# Altium schematic sheet Sensor_Section.SchDoc
size 420 x 297 mm; SheetNumber: 5; SheetTotal: 5
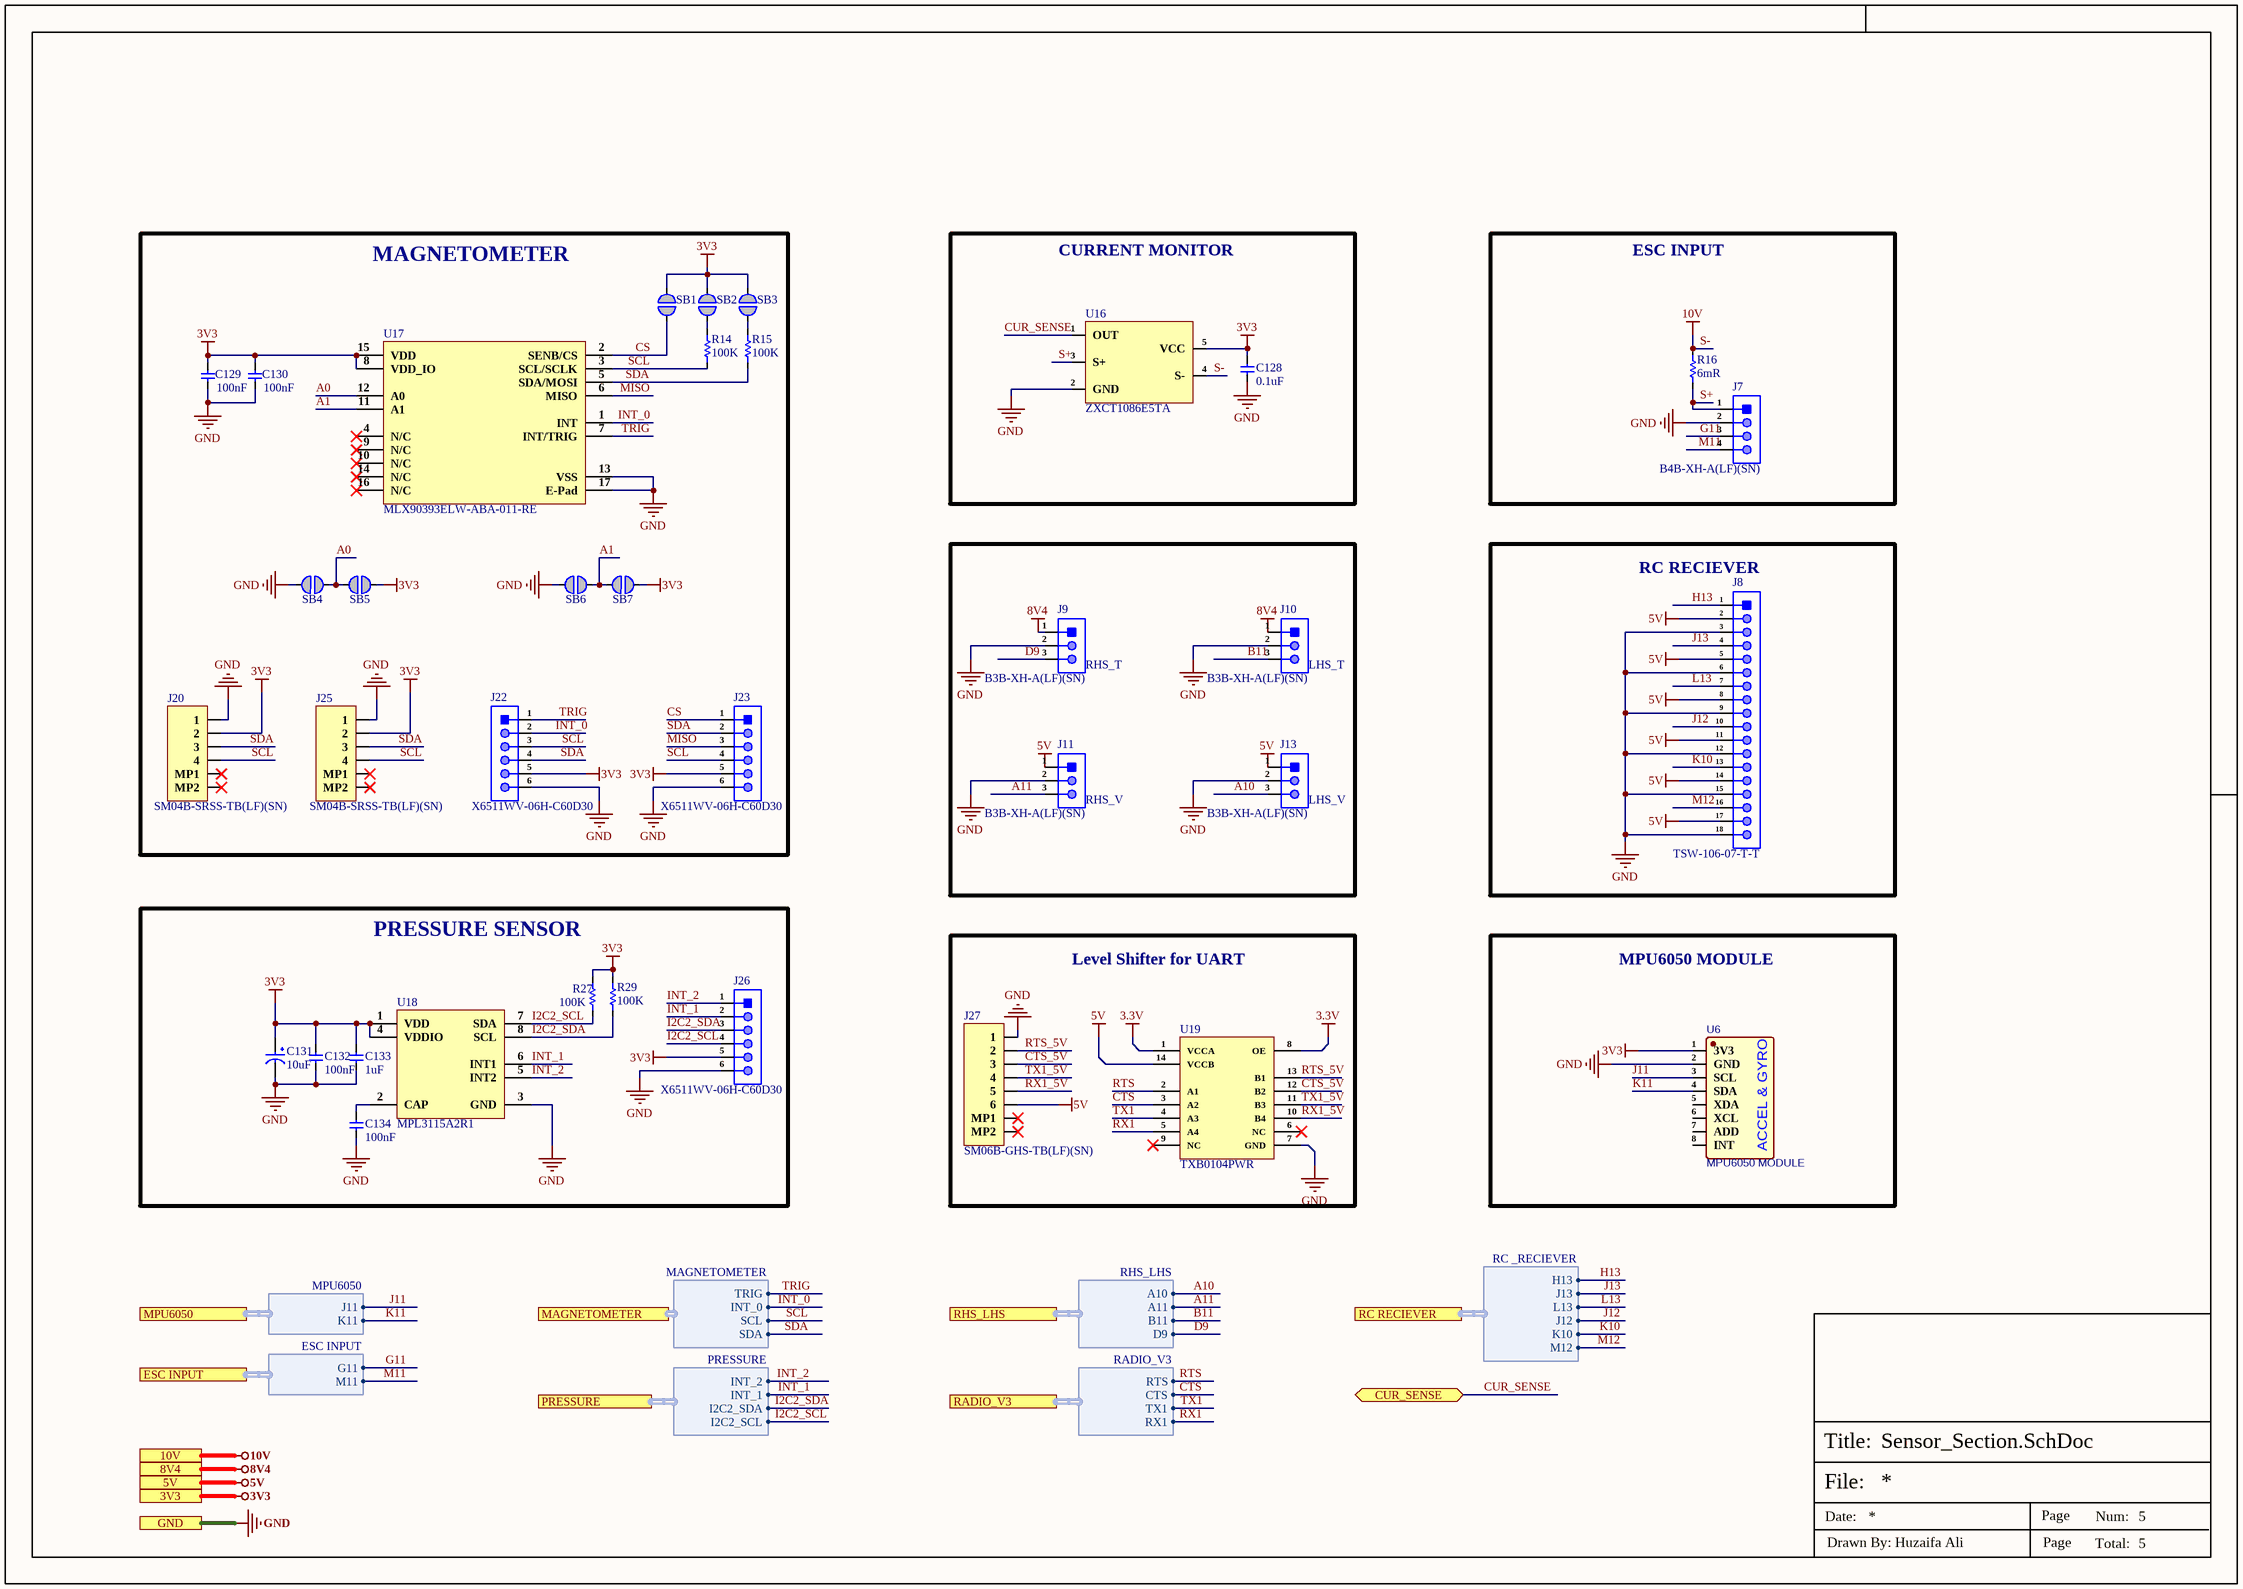
[diagram p0: Sensor_Section.SchDoc]

## Parts
C128  0.1uF  [Cap-0402]
C129  100nF  [cap-0402]
C130  100nF  [cap-0402]
C131  10uF  [Tant-0603]
C132  100nF  [cap-0402]
C133  1uF  [Cap-0402]
C134  100nF  [cap-0402]
J7  B4B-XH-A(LF)(SN)  [B4B-XH-A(LF)(SN).]
J8  TSW-106-07-T-T  [TSW-106-07-T-T]
J9  B3B-XH-A(LF)(SN)  [B3B-XH-A(LF)(SN)_]
J10  B3B-XH-A(LF)(SN)  [B3B-XH-A(LF)(SN)_]
J11  B3B-XH-A(LF)(SN)  [B3B-XH-A(LF)(SN)_]
J13  B3B-XH-A(LF)(SN)  [B3B-XH-A(LF)(SN)_]
J20  SM04B-SRSS-TB(LF)(SN)  [SM04B-SRSS-TB(LF)(SN)]
J22  X6511WV-06H-C60D30  [HDR1X6_]
J23  X6511WV-06H-C60D30  [HDR1X6_]
J25  SM04B-SRSS-TB(LF)(SN)  [SM04B-SRSS-TB(LF)(SN)]
J26  X6511WV-06H-C60D30  [HDR1X6_]
J27  SM06B-GHS-TB(LF)(SN)  [SM06B-GHS-TB(LF)(SN)]
R14  100K  [Res-0402]
R15  100K  [Res-0402]
R16  6mR  [RES-0805]
R27  100K  [Res-0402]
R29  100K  [Res-0402]
SB1  Solder Bridge 0603  [Solder Bridge]  (value not drawn)  (no BOM)
SB2  Solder Bridge 0603  [Solder Bridge]  (value not drawn)  (no BOM)
SB3  Solder Bridge 0603  [Solder Bridge]  (value not drawn)  (no BOM)
SB4  Solder Bridge 0603  [Solder Bridge]  (value not drawn)  (no BOM)
SB5  Solder Bridge 0603  [Solder Bridge]  (value not drawn)  (no BOM)
SB6  Solder Bridge 0603  [Solder Bridge]  (value not drawn)  (no BOM)
SB7  Solder Bridge 0603  [Solder Bridge]  (value not drawn)  (no BOM)
U6  MPU6050 MODULE  [MPU6050_]
U16  ZXCT1086E5TA  [SOT-23-5]
U17  MLX90393ELW-ABA-011-RE  [QFN-16-EP(3x3)]
U18  MPL3115A2R1  [LGA-8(3x5)]
U19  TXB0104PWR  [14-TSSOP]

## Blocks framed on the sheet
MAGNETOMETER: C129 C130 J20 J22 J23 J25 R14 R15 SB1-SB7 U17
CURRENT MONITOR: C128 U16
ESC INPUT: J7 R16
RC RECIEVER: J8
PRESSURE SENSOR: C131-C134 J26 R27 R29 U18
Level Shifter for UART: J27 U19
MPU6050 MODULE: U6

## Ports
3V3 (see Top_Section[4B], Power_Section[1D], Teensy_4.1_Section(B)[4D], Teensy_4.1_Section[5D]), 5V (see Top_Section[4B], Power_Section[1D]), 8V4 (see Top_Section[4B], Power_Section[1D]), 10V (see Top_Section[4B], Power_Section[1D]), CUR_SENSE (bidir, see Top_Section[4B], Teensy_4.1_Section(B)[2D]), ESC INPUT (harness ESC INPUT, see Top_Section[4B], Teensy_4.1_Section[2D]), GND (see Top_Section[5C], Power_Section[1D], Teensy_4.1_Section(B)[4D], Teensy_4.1_Section[5D]), MAGNETOMETER (harness MAGNETOMETER, see Top_Section[4C], Teensy_4.1_Section(B)[1D]), MPU6050 (harness MPU6050, see Top_Section[4B], Teensy_4.1_Section[2D]), PRESSURE (harness PRESSURE, see Top_Section[4C], Teensy_4.1_Section(B)[1D]), RADIO_V3 (harness RADIO_V3, see Top_Section[4C], Teensy_4.1_Section(B)[3D]), RC RECIEVER (harness RC _RECIEVER, see Top_Section[4B], Teensy_4.1_Section[1D]), RHS_LHS (harness RHS_LHS, see Top_Section[4B], Teensy_4.1_Section[1D])

## Harnesses
RC _RECIEVER: H13, J13, L13, J12, K10, M12
RHS_LHS: A10, A11, B11, D9
PRESSURE: INT_2, INT_1, I2C2_SDA, I2C2_SCL
RADIO_V3: RTS, CTS, TX1, RX1
MAGNETOMETER: TRIG, INT_0, SCL, SDA
MPU6050: J11, K11
ESC INPUT: G11, M11

## Nets
3.3V: U19.1(VCCA) U19.8(OE)
3V3: C128.2 C129.2 C130.2 C131.1 C132.2 C133.2 J20.2 J22.5 J23.5 J25.2 J26.5 R27.2 R29.2 SB1.1 SB2.1 SB3.1 SB5.1 SB7.1 U6.1(3V3) U16.5(VCC) U17.8(VDD_IO) U17.15(VDD) U18.1(VDD) U18.4(VDDIO) ; port 3V3
5V: J8.2 J8.5 J8.8 J8.11 J8.14 J8.17 J11.1 J13.1 J27.6 U19.14(VCCB) ; port 5V
8V4: J9.1 J10.1 ; port 8V4
GND: C128.1 C129.1 C130.1 C131.2 C132.1 C133.1 C134.1 J7.2 J8.3 J8.6 J8.9 J8.12 J8.15 J8.18 J9.2 J10.2 J11.2 J13.2 J20.1 J22.6 J23.6 J25.1 J26.6 J27.1 SB4.2 SB6.2 U6.2(GND) U16.2(GND) U17.13(VSS) U17.17(E-Pad) U18.3(GND) U19.7(GND) ; port GND
S-: R16.1 U16.4(S-) ; port 10V  [also labelled 10V]
A0: SB4.1 SB5.2 U17.12(A0)
A1: SB6.1 SB7.2 U17.11(A1)
A10: J13.3 ; port RHS_LHS.A10
A11: J11.3 ; port RHS_LHS.A11
B11: J10.3 ; port RHS_LHS.B11
CS: J23.1 SB1.2 U17.2(SENB/CS)
CTS: U19.3(A2) ; port RADIO_V3.CTS
CTS_5V: J27.3 U19.12(B2)
CUR_SENSE: U16.1(OUT) ; port CUR_SENSE
D9: J9.3 ; port RHS_LHS.D9
G11: J7.3 ; port ESC INPUT.G11
H13: J8.1 ; port RC RECIEVER.H13
I2C2_SCL: J26.4 R27.1 U18.7(SDA) ; port PRESSURE.I2C2_SCL
I2C2_SDA: J26.3 R29.1 U18.8(SCL) ; port PRESSURE.I2C2_SDA
INT_0: J22.2 U17.1(INT) ; port MAGNETOMETER.INT_0
INT_1: J26.2 U18.6(INT1) ; port PRESSURE.INT_1
INT_2: J26.1 U18.5(INT2) ; port PRESSURE.INT_2
J11: U6.3(SCL) ; port MPU6050.J11
J12: J8.10 ; port RC RECIEVER.J12
J13: J8.4 ; port RC RECIEVER.J13
K10: J8.13 ; port RC RECIEVER.K10
K11: U6.4(SDA) ; port MPU6050.K11
L13: J8.7 ; port RC RECIEVER.L13
M11: J7.4 ; port ESC INPUT.M11
M12: J8.16 ; port RC RECIEVER.M12
MISO: J23.3 U17.6(MISO)
RTS: U19.2(A1) ; port RADIO_V3.RTS
RTS_5V: J27.2 U19.13(B1)
RX1: U19.5(A4) ; port RADIO_V3.RX1
RX1_5V: J27.5 U19.10(B4)
S+: J7.1 R16.2 U16.3(S+)
SCL: J20.4 J22.3 J23.4 J25.4 R14.1 U17.3(SCL/SCLK) ; port MAGNETOMETER.SCL
SDA: J20.3 J22.4 J23.2 J25.3 R15.1 U17.5(SDA/MOSI) ; port MAGNETOMETER.SDA
TRIG: J22.1 U17.7(INT/TRIG) ; port MAGNETOMETER.TRIG
TX1: U19.4(A3) ; port RADIO_V3.TX1
TX1_5V: J27.4 U19.11(B3)
NetC134_2: C134.2 U18.2(CAP)
NetR14_2: R14.2 SB2.2
NetR15_2: R15.2 SB3.2

Not connected (* = marked no-connect by the designer): J20 MP1* MP2*; J25 MP1* MP2*; J27 MP1* MP2*; U6 5(XDA) 6(XCL) 7(ADD) 8(INT); U17 4(N/C)* 9(N/C)* 10(N/C)* 14(N/C)* 16(N/C)*; U19 6(NC)* 9(NC)*

## Notes on the sheet
- (near J9) RHS_T
- (near J10) LHS_T
- (near J11) RHS_V
- (near J13) LHS_V
- File:
- Title:
- Date:
- Page
- Num:
- Total:
- Drawn By: Huzaifa Ali
- (in symbol MPU6050 MODULE) ACCEL & GYRO

## Library data of the parts
C128 = CC0402KRX7R8BB104: CAP CER 0.1UF 25V X7R 0402; Manufacturer: Yageo; Tolerance: 10%; Capacitance: 100nF; Dissipation Factor: 3.5%; Supplier 1: Digi-Key; Manufacturer Part Number: CC0402KRX7R8BB104; RoHS: Yes; Category: Ceramic Capacitors; Stock 1: 1841009; Pricing 1: 1=0.10000, 10=0.03100, 50=0.01700, 100=0.01390, 500=0.00990, 1000=0.00777, 2500=0.00707, 5000=0.00650 (USD); Mount: Surface Mount; Case/Package: 0402; Case Code (Imperial): 0402; Case Code (Metric): 1005; Min Operating Temperature: -55°C; Max Operating Temperature: 125°C; Dielectric: X7R; Voltage Rating: 25V; Voltage Rating (DC): 25V; Packaging: Tape and Reel; Termination: SMD/SMT; Resistor Type: Ceramic; Length: 1mm; Width: 0.02inch; Height: 0.5mm; Thickness: 0.022inch; Depth: 0.5mm; Radiation Hardening: No; Lead Free: Lead Free; Halogen Free: Halogen Free; ComponentLink1URL: https://datasheet.ciiva.com/11464/upy-gphc-x7r-6-3v-to-50v-8-11464889.pdf?src-supplier=Avnet; ComponentLink1Description: https://datasheet.ciiva.com/11464/upy-gphc-x7r-6-3v-to-50v-8-11464889.pdf?src-supplier=Avnet; ComponentLink2URL: https://datasheet.ciiva.com/13210/upy-gphc-x7r-6-3v-to-50v-8-12304-13210908.pdf?src-supplier=Mouser; ComponentLink2Description: https://datasheet.ciiva.com/13210/upy-gphc-x7r-6-3v-to-50v-8-12304-13210908.pdf?src-supplier=Mouser; ComponentLink3URL: https://datasheet.ciiva.com/17437/upy-gphc-x7r-6-3v-to-50v-8-17437357.pdf?src-supplier=Avnet+Europe; ComponentLink3Description: https://datasheet.ciiva.com/17437/upy-gphc-x7r-6-3v-to-50v-8-17437357.pdf?src-supplier=Avnet+Europe; Supplier Part Number 1: 311-2077-1-ND; LCSC Part Number: C105883
C129 C130 C132 C134 = C1005X7R1H104KT000F: CAP CER 0.1UF 50V X7R 0402; Manufacturer: TDK; Tolerance: 10%; Voltage: 25V; Item Type: Capacitor; Supplier 1: Avnet; Manufacturer Part Number: C1005X7R1H104KT000F; RoHS: No; Category: Ceramic Capacitors; Dielectric: X7R; Supplier Part Number 1: C1005X7R1H104KT000F; LCSC Part Number: C361198; ComponentLink1Description: LCSC; ComponentLink1URL: https://www.lcsc.com/product-detail/Multilayer-Ceramic-Capacitors-MLCC-SMD-SMT_TDK-C1005X7R1H104KT000F_C361198.html
C131 = T58MM106M6R3C0300: CAP TANT POLY 10UF 6.3V 0603; Manufacturer: Vishay; ESR (Equivalent Series Resistance): 300mR; Tolerance: 20%; Item Type: Capacitor; Supplier: Digi-Key; Supplier Part Number: 718-2111-1-ND; Manufacturer Part Number: T58MM106M6R3C0300; RoHS: Yes; Category: Tantalum Capacitors; Stock: 738; Pricing: 1=0.69, 10=0.462, 50=0.3676, 100=0.3035, 500=0.23714, 1000=0.20158 (USD); Mounting Technology: Surface Mount; Case/Package: 0603; Case Code (Metric): 1608; Case Code (Imperial): 0603; Min Operating Temperature: -55°C; Max Operating Temperature: 105°C; Packaging: Cut Tape; Value: 10uF; Voltage Rating: 6.3V; Voltage Rating (DC): 6.3V; Features: General Purpose; Series: vPolyTan™ T58; Construction: Flat; Length: 1.6mm; Depth: 0.85mm; RoHS Compliant: Yes; Reach SVHC Compliant: Unknown; ComponentLink1URL: http://www.farnell.com/datasheets/2699706.pdf?src-supplier=Farnell; ComponentLink1Description: http://www.farnell.com/datasheets/2699706.pdf?src-supplier=Farnell; ComponentLink2URL: http://www.vishay.com/docs/40189/t58.pdf?src-supplier=Avnet; ComponentLink2Description: http://www.vishay.com/docs/40189/t58.pdf?src-supplier=Avnet; ComponentLink3URL: http://www.farnell.com/datasheets/2028130.pdf?src-supplier=Element14; ComponentLink3Description: http://www.farnell.com/datasheets/2028130.pdf?src-supplier=Element14; ComponentLink4URL: http://www.vishay.com/docs/40189/t58.pdf?src-supplier=Digi-Key; ComponentLink4Description: http://www.vishay.com/docs/40189/t58.pdf?src-supplier=Digi-Key; LCSC Part Number: C2158420
C133 = CC0402KRX5R7BB105: CAP CER 1UF 16V X5R 0402; Manufacturer: Yageo; Tolerance: 10%; Item Type: Capacitor; Supplier 1: Digi-Key; Manufacturer Part Number: CC0402KRX5R7BB105; Stock 1: 1405667; Pricing 1: 1=0.36, 10=0.252, 100=0.1512, 500=0.1134, 1000=0.09576, 2500=0.09072, 5000=0.08568 (USD); Mount: Surface Mount; Case/Package: 0402; Weight: 2.3E-05oz; Case Code (Imperial): 0402; Case Code (Metric): 1005; Min Operating Temperature: -55°C; Max Operating Temperature: 85°C; Capacitance: 1uF; Dielectric: X5R; Packaging: Tape and Reel; Voltage Rating (DC): 16V; Voltage Rating: 16V; Termination: SMD/SMT; Composition: Ceramic; Length: 1mm; Height: 0.5mm; Width: 0.02inch; Thickness: 0.022inch; Depth: 0.5mm; Radiation Hardening: No; Lead Free: Lead Free; Halogen Free: Halogen Free; ComponentLink1URL: http://www.yageo.com/documents/recent/UPY-GPHC_X5R_4V-to-50V_12.pdf?src-supplier=Avnet+Europe; ComponentLink1Description: http://www.yageo.com/documents/recent/UPY-GPHC_X5R_4V-to-50V_12.pdf?src-supplier=Avnet+Europe; Supplier Part Number 1: 311-1691-6-ND; LCSC Part Number: C325464
J7 = B4B-XH-A(LF)(SN): CONN HEADER VERT 4POS 2.5MM; Manufacturer: JST; Current Rating: 3A; Gender: Male; Contact Resistance: 20mR; Voltage Rating (AC): 250V; Connector Type: Male Pin; Number of Positions: 4; Insulation Resistance: 1GR; Wire/Cable Gauge: 22AWG; Item Type: JST Connector; Supplier 1: Future Electronics; Manufacturer Part Number: B4B-XH-A(LF)(SN); RoHS: Yes; Category: FFC / FPC; Pricing 1: 1=0.13000, 300=0.11300, 1000=0.11000, 3000=0.10700, 10000=0.10400 (USD); Mount: Through Hole; Contact Material: Brass; Material: Polyamide; Contact Plating: Tin,Copper,Lead; Color: Natural; Housing Material: Polyamide; Housing Color: White; Min Operating Temperature: -25°C; Max Operating Temperature: 85°C; Number of Rows: 1; Max Current Rating: 3A; Package Quantity: 500; Packaging: Bulk; Voltage Rating: 250V; Termination: Press-Fit; Max Voltage Rating (AC): 250V; Max Voltage Rating (DC): 250V; Number of Contacts: 4; Orientation: Straight; Length: 12.4mm; Pitch: 2.5mm; Lead Pitch: 2.5mm; Depth: 5.75mm; REACH SVHC: No SVHC; Lead Free: Lead Free; ComponentLink1URL: https://datasheet.ciiva.com/26894/getdatasheetpartid-455616-26894787.pdf?src-supplier=Verical; ComponentLink1Description: https://datasheet.ciiva.com/26894/getdatasheetpartid-455616-26894787.pdf?src-supplier=Verical; ComponentLink2URL: https://datasheet.ciiva.com/26924/getdatasheetpartid-640571-26924035.pdf?src-supplier=Verical; ComponentLink2Description: https://datasheet.ciiva.com/26924/getdatasheetpartid-640571-26924035.pdf?src-supplier=Verical; ComponentLink3URL: https://datasheet.ciiva.com/16203/b4b-xh-alfsn-16203642.pdf?src-supplier=Future+Electronics; ComponentLink3Description: https://datasheet.ciiva.com/16203/b4b-xh-alfsn-16203642.pdf?src-supplier=Future+Electronics; ComponentLink4URL: https://datasheet.ciiva.com/726/exh-726404.pdf?src-supplier=Digi-Key; ComponentLink4Description: https://datasheet.ciiva.com/726/exh-726404.pdf?src-supplier=Digi-Key; Supplier Part Number 1: 8134090; LCSC Part Number: C144395
J8 = TSW-106-07-T-T: CONN HEADER VERT 18POS 2.54MM; Manufacturer: Samtec; Item Type: Connectors; Supplier: Arrow Electronics; LCSC Part Number: C5967361; Manufacturer Part Number: TSW-106-07-T-T; RoHS: Yes; Stock: 1529; ComponentLink1URL: http://www.samtec.com/ftppub/pdf/htsw_th.pdf?src-supplier=Avnet; ComponentLink1Description: http://www.samtec.com/ftppub/pdf/htsw_th.pdf?src-supplier=Avnet; ComponentLink2URL: https://datasheet.octopart.com/TSW-106-07-T-T-Samtec-datasheet-97325576.pdf?src-supplier=Sager+Electronics; ComponentLink2Description: https://datasheet.octopart.com/TSW-106-07-T-T-Samtec-datasheet-97325576.pdf?src-supplier=Sager+Electronics
J9-J11 J13 = B3B-XH-A(LF)(SN): CONN HEADER VERT 3POS 2.5MM; Manufacturer: JST; Current Rating: 3A; Number of Positions: 3; Connector Type: Male Pin; Voltage Rating (AC): 250V; Contact Resistance: 20mR; Insulation Resistance: 1GR; Gender: Male; Wire/Cable Gauge: 22AWG; Item Type: JST Connector; Supplier 1: Farnell; Manufacturer Part Number: B3B-XH-A(LF)(SN); RoHS: Yes; Category: Headers and Wire Housings; Stock 1: 114254; Pricing 1: 100=0.09250, 500=0.07700, 1000=0.06470, 2500=0.06340, 5000=0.06210, 10000=0.06080 (GBP); Mount: Through Hole; Contact Plating: Tin,Lead,Copper; Contact Material: Brass; Color: Natural; Housing Color: White; Housing Material: Polyamide; Min Operating Temperature: -25°C; Max Operating Temperature: 85°C; Number of Rows: 1; Packaging: Bulk; Termination: Press-Fit; Max Current Rating: 3A; Voltage Rating: 250V; Fastening Type: Detent; Number of Contacts: 3; Max Voltage Rating (AC): 250V; Max Voltage Rating (DC): 250V; Orientation: Straight; Length: 9.9mm; Pitch: 2.5mm; Lead Pitch: 2.5mm; Depth: 5.75mm; Lead Free: Lead Free; REACH SVHC: No SVHC; ComponentLink1URL: https://datasheet.ciiva.com/26894/getdatasheetpartid-640434-26894454.pdf?src-supplier=Verical; ComponentLink1Description: https://datasheet.ciiva.com/26894/getdatasheetpartid-640434-26894454.pdf?src-supplier=Verical; ComponentLink2URL: https://datasheet.ciiva.com/11746/0900766b8082653f-11746520.pdf?src-supplier=RSComponents; ComponentLink2Description: https://datasheet.ciiva.com/11746/0900766b8082653f-11746520.pdf?src-supplier=RSComponents; ComponentLink3URL: https://datasheet.ciiva.com/26894/getdatasheetpartid-440399-26894778.pdf?src-supplier=Verical; ComponentLink3Description: https://datasheet.ciiva.com/26894/getdatasheetpartid-440399-26894778.pdf?src-supplier=Verical; Supplier Part Number 1: 1516277; LCSC Part Number: C144394
J20 J25 = SM04B-SRSS-TB(LF)(SN): Connector Header, Side Entry, SR Series, 4 Position, 1.00mm, 50V, Surface Mount, Tin, Natural; Manufacturer: JST; Number of Contacts: 4NUMBER; Contact Resistance: 40mR; Max Current Rating: 1A; Number of Positions: 4; Pitch: 1mm; Supplier: Future Electronics; Supplier Part Number: 4517173; Manufacturer Part Number: SM04B-SRSS-TB(LF)(SN); RoHS: Yes; Category: Headers and Wire Housings; Stock: 27000; Pricing: 3000=0.285, 6000=0.275 (USD); Mounting Technology: Surface Mount; Contact Material: Copper Alloy; Contact Plating: Copper,Tin; Housing Color: Beige; Housing Material: Polyamide; Contact Shape: Square; Contact Finish - Mating: TIN; Insulation Material: Nylon; Insulation Color: Natural; Min Operating Temperature: -25°C; Max Operating Temperature: 85°C; Number of Rows: 1; Termination: Solder; Orientation: Right Angle; Voltage Rating: 50V; Packaging: Tape and Reel; Max Voltage Rating (AC): 50V; Max Voltage Rating (DC): 50V; Connector Type: Header; Fastening Type: Pull; Series: SR; Contact Type: Male Pin; Length: 6mm; Depth: 4.95mm; Flammability Rating: UL94 V-0; ComponentLink1URL: https://datasheet.ciiva.com/26894/getdatasheetpartid-640736-26894676.pdf?src-supplier=Verical; ComponentLink1Description: https://datasheet.ciiva.com/26894/getdatasheetpartid-640736-26894676.pdf?src-supplier=Verical; ComponentLink2URL: https://datasheet.ciiva.com/26894/getdatasheetpartid-499363-26894945.pdf?src-supplier=Verical; ComponentLink2Description: https://datasheet.ciiva.com/26894/getdatasheetpartid-499363-26894945.pdf?src-supplier=Verical; ComponentLink3URL: https://datasheet.ciiva.com/16487/jstsm04b-srss-tb-lf-sn-16487222.pdf?src-supplier=Future+Electronics; ComponentLink3Description: https://datasheet.ciiva.com/16487/jstsm04b-srss-tb-lf-sn-16487222.pdf?src-supplier=Future+Electronics; LCSC Part No: C160404; ComponentLink4Description: LCSC; ComponentLink4URL: https://www.lcsc.com/product-detail/Wire-To-Board-Connector_JST-SM04B-SRSS-TB-LF-SN_C160404.html
J22 J23 J26 = X6511WV-06H-C60D30: Gold 250V 3A Straight Square Pins 2.5mm 6P 260℃ 6mm -40℃~+105℃ 3mm 2.54mm Plugin Black Brass 1x6P Plugin,P=2.54mm Pin Headers ROHS; Manufacturer: XKB; Item Type: Male Header; Manufacturer Part Number: X6511WV-06H-C60D30; Package: Plugin,P=2.54mm; LCSC Part Number: C706878; ComponentLink1Description: LCSC; ComponentLink1URL: https://www.lcsc.com/product-detail/Pin-Headers_XKB-Connectivity-X6511WV-06H-C60D30_C706878.html
J27 = SM06B-GHS-TB(LF)(SN): CONN HEADER SMD R/A 6POS 1.25MM; Manufacturer: JST; Number of Positions: 6; Current Rating: 1A; Voltage Rating: 50V; Supplier: Future Electronics; LCSC Part Number: C133065; Manufacturer Part Number: SM06B-GHS-TB(LF)(SN); RoHS: Yes; Item Type: Headers; Pricing: 2500=0.25, 5000=0.245, 7500=0.24, 10000=0.235 (USD); Mounting Technology: Surface Mount; Contact Material: Bronze; Contact Shape: Rectangular; Contact Finish - Mating: TIN; Insulation Material: Nylon; Insulation Color: Natural; Min Operating Temperature: -25°C; Max Operating Temperature: 85°C; Number of Rows: 1; Packaging: Cut Tape; Termination: Solder; Fastening Type: Ramp; Connector Type: Header; Number of Contacts: 6; Orientation: Right Angle; Series: GH; Contact Type: Outer Shroud Contact; Pitch: 1.25mm; Lead Free: Lead Free; Flammability Rating: UL94 V-0; ComponentLink1URL: https://datasheet.ciiva.com/25617/0900766b810cef18-25617251.pdf?src-supplier=Rs; ComponentLink1Description: https://datasheet.ciiva.com/25617/0900766b810cef18-25617251.pdf?src-supplier=Rs; ComponentLink2URL: https://datasheet.ciiva.com/16487/jstsm06b-ghs-tb-lf-sn-16487196.pdf?src-supplier=Future+Electronics; ComponentLink2Description: https://datasheet.ciiva.com/16487/jstsm06b-ghs-tb-lf-sn-16487196.pdf?src-supplier=Future+Electronics
R14 R15 R27 R29 = RC0402FR-07100KL: RES 100K OHM 1% 1/16W 0402; Manufacturer: Yageo; Resistance: 100kR; Temperature Coefficient: 100ppm/°C; Power Rating: 63mW; Voltage Rating: 50V; Item Type: Resistor; Supplier 1: Mouser; Manufacturer Part Number: RC0402FR-07100KL; RoHS: Yes; Category: Chip SMD Resistors; Stock 1: 7759549; Pricing 1: 1=0.10000, 10=0.01200, 50=0.01200, 100=0.00500, 1000=0.00300, 2500=0.00200, 10000=0.00100 (USD); Case/Package: 0402; Case Code (Metric): 1005; Case Code (Imperial): 0402; Min Operating Temperature: -55°C; Max Operating Temperature: 155°C; Resistor Type: Thick Film; Tolerance: 1%; Packaging: Tape and Reel; Package Quantity: 1; Number of Terminations: 2; Termination: SMD/SMT; Max Power Dissipation: 63mW; Working Voltage: 50V; Features: Moisture Resistant; Series: RC; Resistance Tolerance: 1%; Construction: Rectangular; Technology: THICK FILM; Length: 0.039inch; Width: 0.02inch; Height: 0.016inch; Depth: 0.5mm; REACH SVHC: No SVHC; Lead Free: Lead Free; RoHS Compliant: Yes; Military Standard: Not; ComponentLink1URL: https://datasheet.ciiva.com/11819/0900766b80c66297-11819452.pdf?src-supplier=RSComponents; ComponentLink1Description: https://datasheet.ciiva.com/11819/0900766b80c66297-11819452.pdf?src-supplier=RSComponents; ComponentLink2URL: https://datasheet.ciiva.com/22747/1018594-22747509.pdf?src-supplier=Element14; ComponentLink2Description: https://datasheet.ciiva.com/22747/1018594-22747509.pdf?src-supplier=Element14; ComponentLink3URL: https://datasheet.ciiva.com/2453/pyu-r-int-thick-7-2453362.pdf?src-supplier=Digi-Key; ComponentLink3Description: https://datasheet.ciiva.com/2453/pyu-r-int-thick-7-2453362.pdf?src-supplier=Digi-Key; ComponentLink4URL: https://datasheet.ciiva.com/2453/pyu-r-int-thick-7-2453363.pdf?src-supplier=Digi-Key; ComponentLink4Description: https://datasheet.ciiva.com/2453/pyu-r-int-thick-7-2453363.pdf?src-supplier=Digi-Key; ComponentLink5URL: https://datasheet.ciiva.com/2453/pyu-r-int-thick-7-2453361.pdf?src-supplier=Digi-Key; ComponentLink5Description: https://datasheet.ciiva.com/2453/pyu-r-int-thick-7-2453361.pdf?src-supplier=Digi-Key; ComponentLink6URL: https://datasheet.ciiva.com/12667/pyu-rc0402-51-rohs-l-6-r-12667930.pdf?src-supplier=Mouser; ComponentLink6Description: https://datasheet.ciiva.com/12667/pyu-rc0402-51-rohs-l-6-r-12667930.pdf?src-supplier=Mouser; ComponentLink7URL: https://datasheet.ciiva.com/15189/getdatasheetpartid-323696-15189334.pdf?src-supplier=Verical; ComponentLink7Description: https://datasheet.ciiva.com/15189/getdatasheetpartid-323696-15189334.pdf?src-supplier=Verical; Supplier Part Number 1: 603-RC0402FR-07100KL; LCSC Part Number: C60491
R16 = RLM10FTSMR006: 500mW 6mΩ ±50ppm/℃ ±1% 0805 Current Sense Resistors / Shunt Resistors ROHS; Manufacturer: TA-I Tech; Manufacturer Part Number: RLM10FTSMR006; Package: 0805; LCSC Part Number: C163092; Item Type: Resistor; ComponentLink1Description: LCSC; ComponentLink1URL: https://www.lcsc.com/product-detail/Current-Sense-Resistors-Shunt-Resistors_TA-I-Tech-RLM10FTSMR006_C163092.html
SB1-SB7 = Solder Bridge 0603: Solder Bridge ON; Manufacturer Part Number: Solder Bridge; Item Type: Solder Bridge
U6 = MPU6050 MODULE: GY-521 6DOF 3 Axis Analog Gyro Sensor + 3 Axis Accelerometer Module; Contributor: jofenix; Manufacturer Part Number: MPU6050; Supplier: Aliexpress; spicePre: U; spiceSymbolName: MPU6050 MODULE
U16 = ZXCT1086E5TA: IC CURRENT MONITOR SOT25; Manufacturer: Diodes; Supplier: Future Electronics; LCSC Part Number: C154866; Manufacturer Part Number: ZXCT1086E5TA; RoHS: Yes; Item Type: IC; Stock: 9000; Pricing: 3000=0.69, 6000=0.665 (USD); ComponentLink1URL: https://datasheet.ciiva.com/1484/1383709-1484867.pdf?src-supplier=Element14; ComponentLink1Description: https://datasheet.ciiva.com/1484/1383709-1484867.pdf?src-supplier=Element14
U17 = MLX90393ELW-ABA-011-RE: QFN-16-EP(3x3) 3D Magnetic Sensors ROHS; Manufacturer: Melexis; Item Type: IC; Manufacturer Part Number: MLX90393ELW-ABA-011-RE; Package: QFN-16-EP(3x3); LCSC Part Number: C2654971
U18 = MPL3115A2R1: 50Kpa~110Kpa LGA-8(3x5) Pressure Sensors ROHS; Manufacturer: NXP Semicon; Item Type: IC; Manufacturer Part Number: MPL3115A2R1; Package: LGA-8(3x5); LCSC Part Number: C54429; ComponentLink1Description: LCSC; ComponentLink1URL: https://www.lcsc.com/product-detail/Pressure-Sensors_NXP-Semicon-MPL3115A2R1_C54429.html
U19 = TXB0104PWR: IC TRANSLATOR BIDIR 14TSSOP; Manufacturer: Texas Instruments; Propagation Delay: 31ns; Min Supply Voltage: 1.2V; Max Supply Voltage: 5.5V; Data Rate: 100Mbps; Number of Channels: 4; Turn-On Delay Time: 7.4ns; High Level Output Current: -20uA; Low Level Output Current: 20uA; Quiescent Current: 3.5uA; Output Type: 3-STATE; Nominal Supply Current: 5uA; Number of Circuits: 1; Channel Type: Bidirectional; Supplier 1: Arrow Electronics; Manufacturer Part Number: TXB0104PWR; RoHS: Yes; Category: Voltage Level Shifters; Stock 1: 1658; Pricing 1: 1=1.50780, 10=1.39060, 25=1.29340, 100=1.11370, 250=1.03790, 500=0.97230, 1000=0.92410 (USD); Mount: Surface Mount; Case/Package: TSSOP; Number of Pins: 14; Weight: 0.002018oz; Min Operating Temperature: -40°C; Max Operating Temperature: 85°C; Packaging: Tape and Reel; Package Quantity: 2000; Logic Function: Translator; Number of Bits: 4; Series: -; Number of Inputs: 4; Output Current: 20uA; Length: 5mm; Width: 4.4mm; Height: 1.15mm; Radiation Hardening: No; Reach SVHC Compliant: Yes; Lead Free: Lead Free; RoHS Compliant: Yes; ComponentLink1URL: https://datasheet.ciiva.com/1508/1633692-1508723.pdf?src-supplier=Element14; ComponentLink1Description: https://datasheet.ciiva.com/1508/1633692-1508723.pdf?src-supplier=Element14; ComponentLink2URL: https://datasheet.ciiva.com/22653/1845221-22653354.pdf?src-supplier=Farnell; ComponentLink2Description: https://datasheet.ciiva.com/22653/1845221-22653354.pdf?src-supplier=Farnell; ComponentLink3URL: https://datasheet.ciiva.com/15096/getdatasheetpartid-48026-15096134.pdf?src-supplier=Verical; ComponentLink3Description: https://datasheet.ciiva.com/15096/getdatasheetpartid-48026-15096134.pdf?src-supplier=Verical; ComponentLink4URL: https://datasheet.ciiva.com/1508/1849862-1508724.pdf?src-supplier=Element14; ComponentLink4Description: https://datasheet.ciiva.com/1508/1849862-1508724.pdf?src-supplier=Element14; ComponentLink5URL: https://datasheet.ciiva.com/46395/1864432-46395886.pdf?src-supplier=Element14; ComponentLink5Description: https://datasheet.ciiva.com/46395/1864432-46395886.pdf?src-supplier=Element14; ComponentLink6URL: https://datasheet.ciiva.com/1899/txb0104-1899515.pdf?src-supplier=Digi-Key; ComponentLink6Description: https://datasheet.ciiva.com/1899/txb0104-1899515.pdf?src-supplier=Digi-Key; ComponentLink7URL: https://datasheet.ciiva.com/1899/txb0104-1899514.pdf?src-supplier=Digi-Key; ComponentLink7Description: https://datasheet.ciiva.com/1899/txb0104-1899514.pdf?src-supplier=Digi-Key; ComponentLink8URL: https://datasheet.ciiva.com/1899/txb0104-1899516.pdf?src-supplier=Digi-Key; ComponentLink8Description: https://datasheet.ciiva.com/1899/txb0104-1899516.pdf?src-supplier=Digi-Key; ComponentLink9URL: https://datasheet.ciiva.com/14287/txb0104-14287375.pdf?src-supplier=Avnet; ComponentLink9Description: https://datasheet.ciiva.com/14287/txb0104-14287375.pdf?src-supplier=Avnet; Supplier Part Number 1: TXB0104PWR; LCSC Part Number: C60708; Item Type: IC